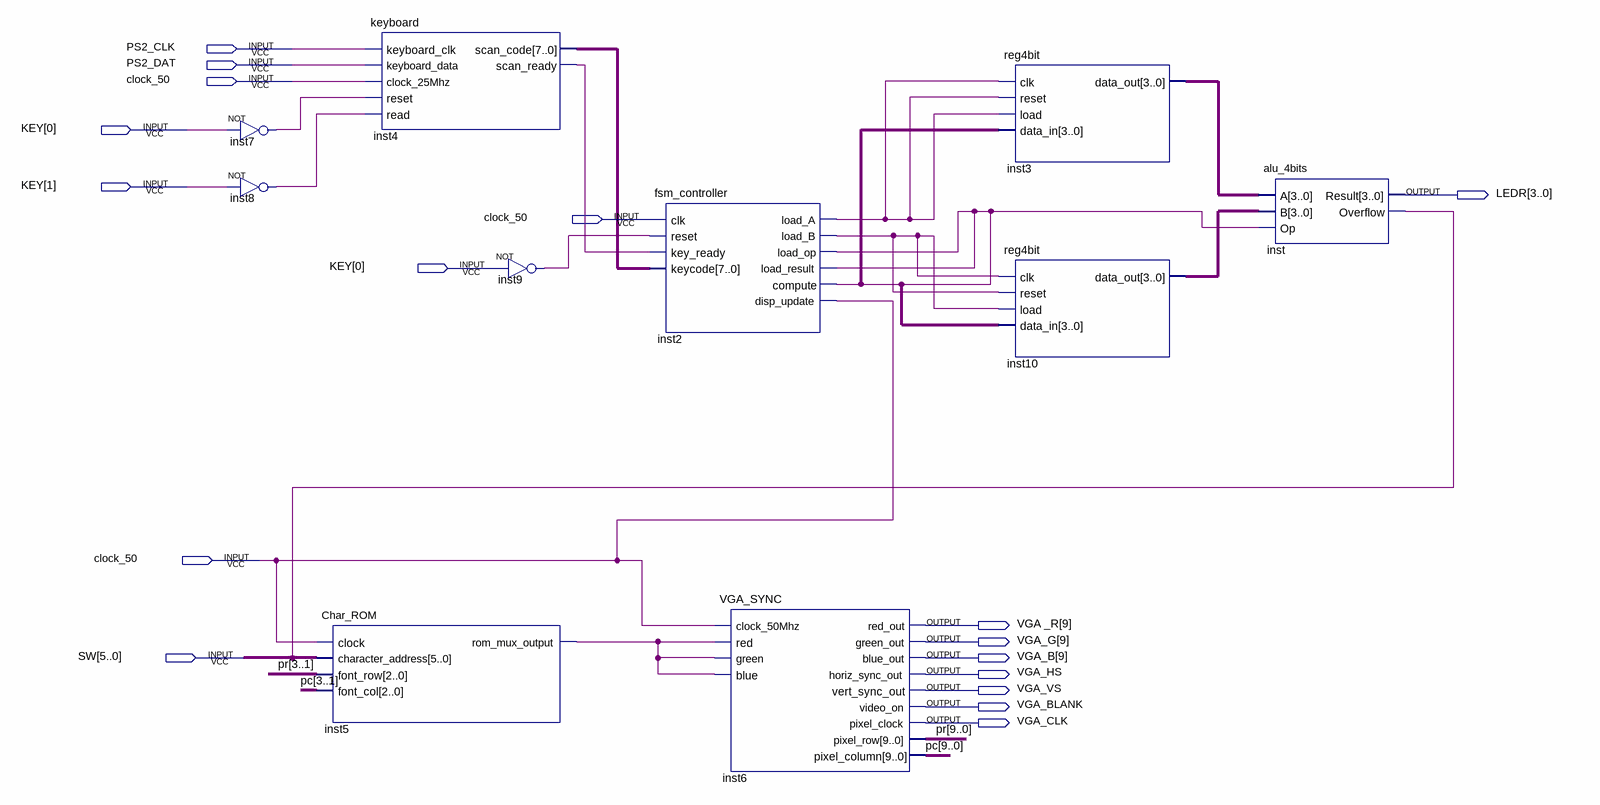
[diagram p0: schematic sheet]
// Quartus schematic FourBitCalculator.bdf as structural Verilog: 10 symbols, 17 pins
module FourBitCalculator (
  input  PS2_CLK,
  input  PS2_DAT,
  input  clock_50,
  input  [1:0] KEY,
  input  [5:0] SW,
  output [3:0] LEDR,
  output [9:9] \VGA__R ,
  output [9:9] VGA_G,
  output [9:9] VGA_B,
  output VGA_HS,
  output VGA_VS,
  output VGA_BLANK,
  output VGA_CLK
);

  wire inst2_load_a, inst2_load_b, inst2_load_op, inst4_scan_ready, inst5_rom_mux_output, inst7_out,
       inst8_out, inst9_out, inst_overflow;
  wire [3:0] inst3_data_out, inst10_data_out, undriven, undriven_2;
  wire [7:0] inst4_scan_code;
  wire [9:0] pc, pr;

  not inst7 (inst7_out, KEY[0]);
  not inst8 (inst8_out, KEY[1]);
  Char_ROM inst5 (
    .clock(clock_50), .character_address(SW), .font_row(pr[3:1]), .font_col(pc[3:1]),
    .rom_mux_output(inst5_rom_mux_output));
  keyboard inst4 (
    .keyboard_clk(PS2_CLK), .keyboard_data(PS2_DAT), .clock_25Mhz(clock_50), .reset(inst7_out),
    .read(inst8_out), .scan_code(inst4_scan_code), .scan_ready(inst4_scan_ready));
  not inst9 (inst9_out, KEY[0]);
  fsm_controller inst2 (
    .clk(clock_50), .reset(inst9_out), .key_ready(inst4_scan_ready), .keycode(inst4_scan_code),
    .load_A(inst2_load_a), .load_B(inst2_load_b), .load_op(inst2_load_op), .load_result(inst2_load_op),
    .compute(inst2_load_op), .disp_update(clock_50));
  VGA_SYNC inst6 (
    .clock_50Mhz(clock_50), .red(inst5_rom_mux_output), .green(inst5_rom_mux_output),
    .blue(inst5_rom_mux_output), .red_out(\VGA__R [9]), .green_out(VGA_G[9]), .blue_out(VGA_B[9]),
    .horiz_sync_out(VGA_HS), .vert_sync_out(VGA_VS), .video_on(VGA_BLANK), .pixel_clock(VGA_CLK),
    .pixel_row(pr), .pixel_column(pc));
  reg4bit inst3 (
    .clk(inst2_load_a), .reset(inst2_load_a), .load(inst2_load_a), .data_in(undriven),
    .data_out(inst3_data_out));
  reg4bit inst10 (
    .clk(inst2_load_b), .reset(inst2_load_b), .load(inst2_load_b), .data_in(undriven_2),
    .data_out(inst10_data_out));
  alu_4bits inst (.A(inst3_data_out), .B(inst10_data_out), .Op(inst2_load_op), .Result(LEDR), .Overflow(inst_overflow));
endmodule
